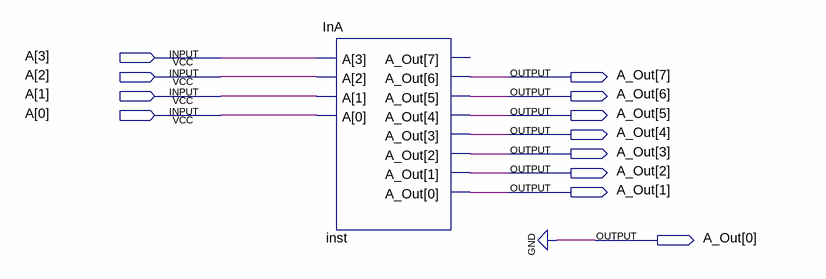
[diagram p0: schematic sheet]
// Quartus schematic shift_left_1.bdf as structural Verilog: 1 symbols, 12 pins
module shift_left_1 (
  input  [3:0] A,
  output [7:0] A_Out
);
  wire [7:0] inst_a_out_open;  // unused outputs

  InA inst (.A(A), .A_Out({inst_a_out_open[7], A_Out[7:1]}));

  assign A_Out[0] = 1'b0;
endmodule
